# Altium schematic sheet Telemetry.SchDoc
size A3; SheetNumber: 6; SheetTotal: 7
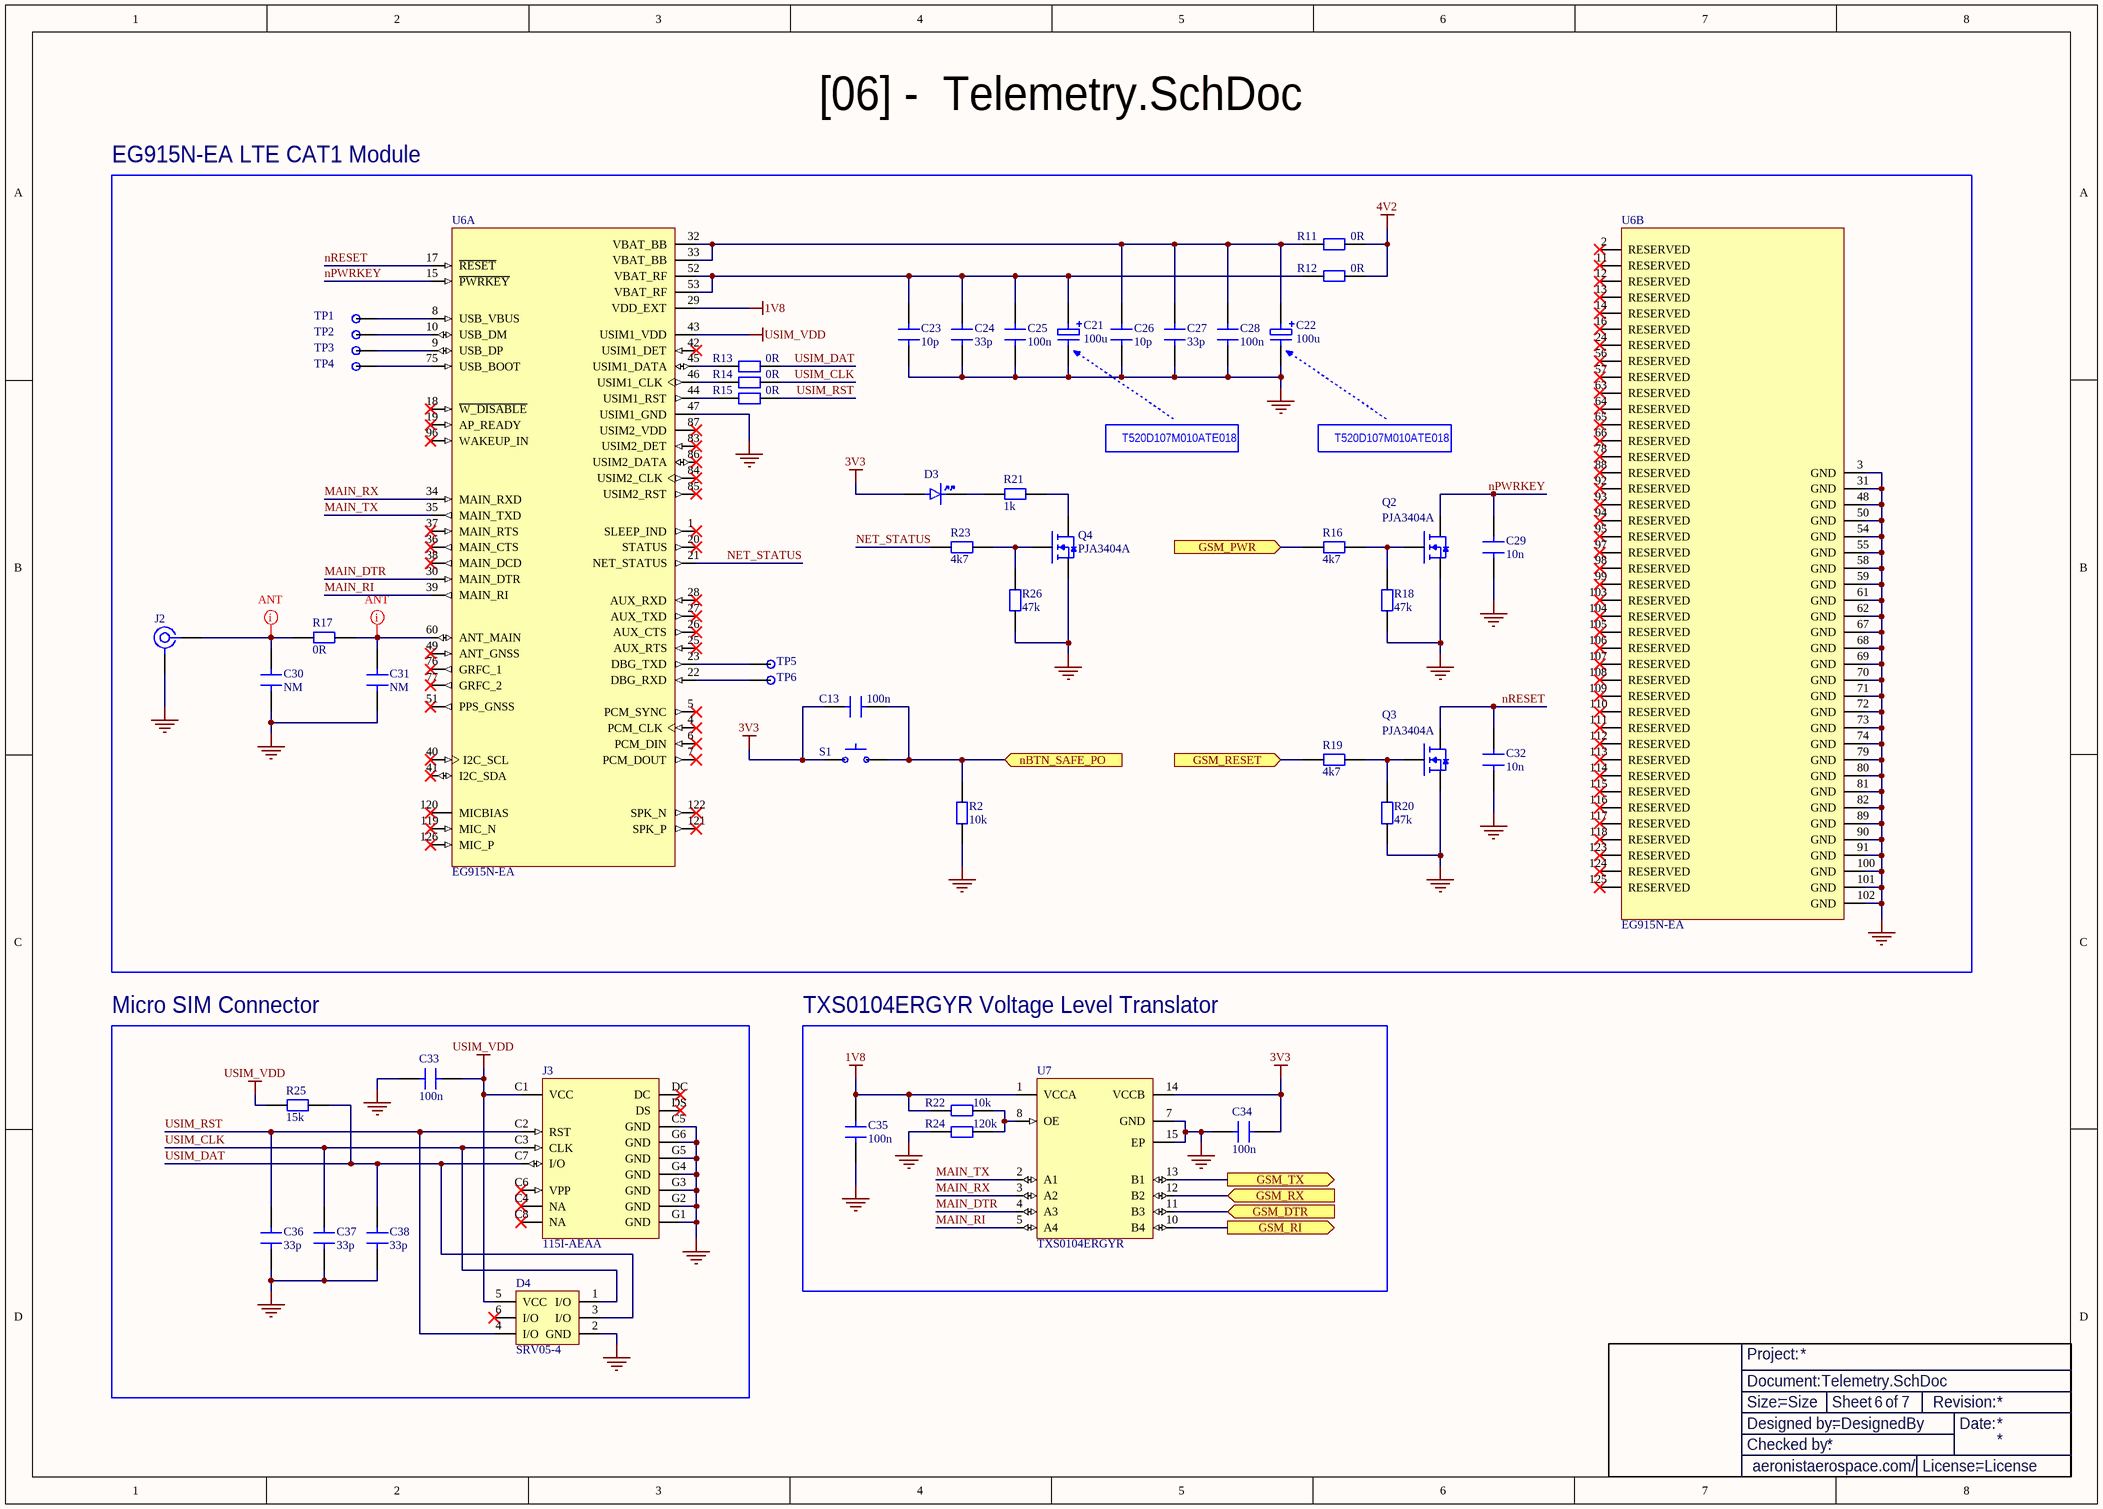
[diagram p0: Telemetry.SchDoc]

## Parts
?  Title Block  (value not drawn)  (graphical)
C13  100n  [CAP 0402]
C21  100u  [CAP TANT D Case]
C22  100u  [CAP TANT D Case]
C23  10p  [CAP 0402]
C24  33p  [CAP 0402]
C25  100n  [CAP 0402]
C26  10p  [CAP 0402]
C27  33p  [CAP 0402]
C28  100n  [CAP 0402]
C29  10n  [CAP 0402]
C30  NM  [CAP 0402]
C31  NM  [CAP 0402]
C32  10n  [CAP 0402]
C33  100n  [CAP 0402]
C34  100n  [CAP 0402]
C35  100n  [CAP 0402]
C36  33p  [CAP 0402]
C37  33p  [CAP 0402]
C38  33p  [CAP 0402]
D3  LED 0805  [LED 0805]  (value not drawn)
D4  SRV05-4  [SOT-23-6]
J2  L-KLS1-SMA-KWE-7X7-15.1  [CONN SMA THT R/A]  (value not drawn)
J3  115I-AEAA  [115I-AEAA]
Q2  PJA3404A  [SOT23-3]
Q3  PJA3404A  [SOT23-3]
Q4  PJA3404A  [SOT23-3]
R2  10k  [RES 0402]
R11  0R  [RES 0805]
R12  0R  [RES 0805]
R13  0R  [RES 0402]
R14  0R  [RES 0402]
R15  0R  [RES 0402]
R16  4k7  [RES 0402]
R17  0R  [RES 0402]
R18  47k  [RES 0402]
R19  4k7  [RES 0402]
R20  47k  [RES 0402]
R21  1k  [RES 0402]
R22  10k  [RES 0402]
R23  4k7  [RES 0402]
R24  120k  [RES 0402]
R25  15k  [RES 0402]
R26  47k  [RES 0402]
S1  SW Tact 4.6x3.2mm  [SW TACT 4.6X3.2MM]  (value not drawn)
TP1  Test Point  [Test Point]  (value not drawn)
TP2  Test Point  [Test Point]  (value not drawn)
TP3  Test Point  [Test Point]  (value not drawn)
TP4  Test Point  [Test Point]  (value not drawn)
TP5  Test Point  [Test Point]  (value not drawn)
TP6  Test Point  [Test Point]  (value not drawn)
U6  EG915N-EA  [EG915N]  (parts A,B of 2)
U7  TXS0104ERGYR  [VQFN-14]

## Blocks framed on the sheet
EG915N-EA LTE CAT1 Module: C13 C21-C32 D3 J2 Q2-Q4 R2 R11-R21 R23 R26 S1 TP1-TP6 U6
Micro SIM Connector: C33 C36-C38 D4 J3 R25
TXS0104ERGYR Voltage Level Translator: C34 C35 R22 R24 U7

## Ports
GSM_DTR (in, see MCU[6C]), GSM_PWR (in, see MCU[6C]), GSM_RESET (in, see MCU[6C]), GSM_RI (out, see MCU[6C]), GSM_RX (in, see MCU[6C]), GSM_TX (out, see MCU[6C]), nBTN_SAFE_PO (in, see MCU[4C])

## Nets
1V8: C35.1 R22.2 U6.29(VDD_EXT) U7.1(VCCA)
3V3: C13.2 C34.1 D3.A S1.4 U7.14(VCCB)
4V2: R11.2 R12.2
GND: C21.2 C22.2 C23.1 C24.1 C25.1 C26.1 C27.1 C28.1 C29.1 C30.2 C31.2 C32.1 C33.2 C34.2 C35.2 C36.2 C37.2 C38.2 D4.2(GND) J2.2 J3.C5(GND) J3.G1(GND) J3.G2(GND) J3.G3(GND) J3.G4(GND) J3.G5(GND) J3.G6(GND) Q2.2(S) Q3.2(S) Q4.2(S) R2.2 R18.2 R20.2 R24.1 R26.2 U6.3(GND) U6.31(GND) U6.47(USIM1_GND) U6.48(GND) U6.50(GND) U6.54(GND) U6.55(GND) U6.58(GND) U6.59(GND) U6.61(GND) U6.62(GND) U6.67(GND) U6.68(GND) U6.69(GND) U6.70(GND) U6.71(GND) U6.72(GND) U6.73(GND) U6.74(GND) U6.79(GND) U6.80(GND) U6.81(GND) U6.82(GND) U6.89(GND) U6.90(GND) U6.91(GND) U6.100(GND) U6.101(GND) U6.102(GND) U7.7(GND) U7.15(EP)
USIM_VDD: C33.1 D4.5(VCC) J3.C1(VCC) R25.1 U6.43(USIM1_VDD)
GSM_DTR: U7.11(B3) ; port GSM_DTR
GSM_PWR: R16.2 ; port GSM_PWR
GSM_RESET: R19.2 ; port GSM_RESET
GSM_RI: U7.10(B4) ; port GSM_RI
GSM_RX: U7.12(B2) ; port GSM_RX
GSM_TX: U7.13(B1) ; port GSM_TX
MAIN_DTR: U6.30(MAIN_DTR) U7.4(A3)
MAIN_RI: U6.39(MAIN_RI) U7.5(A4)
MAIN_RX: U6.34(MAIN_RXD) U7.3(A2)
MAIN_TX: U6.35(MAIN_TXD) U7.2(A1)
nBTN_SAFE_PO: C13.1 R2.1 S1.2 ; port nBTN_SAFE_PO
NET_STATUS: R23.2 U6.21(NET_STATUS)
nPWRKEY: C29.2 Q2.3(D) U6.15(~{PWRKEY})
nRESET: C32.2 Q3.3(D) U6.17(~{RESET})
USIM_CLK: C37.1 D4.1(I/O) J3.C3(CLK) R14.1
USIM_DAT: C38.1 D4.3(I/O) J3.C7(I/O) R13.1 R25.2
USIM_RST: C36.1 D4.4(I/O) J3.C2(RST) R15.1
NetC21_1: C21.1 C23.2 C24.2 C25.2 R12.1 U6.52(VBAT_RF) U6.53(VBAT_RF)
NetC22_1: C22.1 C26.2 C27.2 C28.2 R11.1 U6.32(VBAT_BB) U6.33(VBAT_BB)
NetC30_1: C30.1 J2.1 R17.1
NetC31_1: C31.1 R17.2 U6.60(ANT_MAIN)
NetD3_K: D3.K R21.1
NetQ2_1: Q2.1(G) R16.1 R18.1
NetQ3_1: Q3.1(G) R19.1 R20.1
NetQ4_1: Q4.1(G) R23.1 R26.1
NetQ4_3: Q4.3(D) R21.2
NetR13_2: R13.2 U6.45(USIM1_DATA)
NetR14_2: R14.2 U6.46(USIM1_CLK)
NetR15_2: R15.2 U6.44(USIM1_RST)
NetR22_1: R22.1 R24.2 U7.8(OE)
NetTP1_TP: TP1.TP U6.8(USB_VBUS)
NetTP2_TP: TP2.TP U6.10(USB_DM)
NetTP3_TP: TP3.TP U6.9(USB_DP)
NetTP4_TP: TP4.TP U6.75(USB_BOOT)
NetTP5_TP: TP5.TP U6.23(DBG_TXD)
NetTP6_TP: TP6.TP U6.22(DBG_RXD)

Not connected (* = marked no-connect by the designer): D4 6(I/O)*; J3 C4(NA)* C6(VPP)* C8(NA)* DC* DS*; U6 1(SLEEP_IND)* 2(RESERVED)* 4(PCM_CLK)* 5(PCM_SYNC)* 6(PCM_DIN)* 7(PCM_DOUT)* 11(RESERVED)* 12(RESERVED)* 13(RESERVED)* 14(RESERVED)* 16(RESERVED)* 18(~{W_DISABLE})* 19(AP_READY)* 20(STATUS)* 24(RESERVED)* 25(AUX_RTS)* 26(AUX_CTS)* 27(AUX_TXD)* 28(AUX_RXD)* 36(MAIN_CTS)* 37(MAIN_RTS)* 38(MAIN_DCD)* 40(I2C_SCL)* 41(I2C_SDA)* 42(USIM1_DET)* 49(ANT_GNSS)* 51(PPS_GNSS)* 56(RESERVED)* 57(RESERVED)* 63(RESERVED)* 64(RESERVED)* 65(RESERVED)* 66(RESERVED)* 76(GRFC_1)* 77(GRFC_2)* 78(RESERVED)* 83(USIM2_DET)* 84(USIM2_CLK)* 85(USIM2_RST)* 86(USIM2_DATA)* 87(USIM2_VDD)* 88(RESERVED)* 92(RESERVED)* 93(RESERVED)* 94(RESERVED)* 95(RESERVED)* 96(WAKEUP_IN)* 97(RESERVED)* 98(RESERVED)* 99(RESERVED)* 103(RESERVED)* 104(RESERVED)* 105(RESERVED)* 106(RESERVED)* 107(RESERVED)* 108(RESERVED)* 109(RESERVED)* 110(RESERVED)* 111(RESERVED)* 112(RESERVED)* 113(RESERVED)* 114(RESERVED)* 115(RESERVED)* 116(RESERVED)* 117(RESERVED)* 118(RESERVED)* 119(MIC_N)* 120(MICBIAS)* 121(SPK_P)* 122(SPK_N)* 123(RESERVED)* 124(RESERVED)* 125(RESERVED)* 126(MIC_P)*

## Layout directives
net class ANT: NetC30_1, NetC31_1

## Notes on the sheet
- [06] -  Telemetry.SchDoc
- T520D107M010ATE018
- (in symbol Title Block) Project:; Document:; Size:; Sheet; of; Revision:; Designed by:; Date:; Checked by:; aeronistaerospace.com/; License:

## Library data of the parts
C13 C23-C38 = CAP 0402: Capacitor SMD 0402
C21 C22 = CAP TANT D Case: Capacitor Tantalum SMD D Case
D3 = LED 0805: LED 0805 SMD
D4 = SRV05-4: SRV Series 17.5 V 3 pF SMT RailClamp® Low Capacitance TVS Diode Array SOT-23-6; Manufacturer: Semtech; Manufacturer Part Number: SRV05-4.TCT; Breakdown Voltage: 6V; Value: 5pF; Clamping Voltage: 12.5V; Current: 5A; Direction: Unidirectional; ESD Protection: Yes; Leakage Current: 5µA; Max Power Dissipation: 300W; Number of Bidirectional Channels: 4; Number of Elements: 1; Operating Supply Voltage: 5V; Peak Pulse Current: 12A; Test Current: 1mA; Supplier: Arrow Electronics; Supplier Part Number: SRV05-4.TCT; RoHS: Compliant; Category: TVS Diodes; Stock: 1665000; Pricing: 3000=0,3492 (USD); Case/Package: SOT-23; China RoHS: Compliant; Depth: 1.6mm; Height: 1.15mm; Lead Free: Lead Free; Length: 2.9mm; Lifecycle Status: Production; Max Breakdown Voltage: 6V; Max Operating Temperature: 125°C; Max Reverse Leakage Current: 5µA; Min Breakdown Voltage: 6V; Min Operating Temperature: -55°C; Mounting Technology: Surface Mount; Number of Channels: 4; Pins: 6; Number of Terminals: 6; Packaging: Cut Tape; Peak Pulse Power: 300W; Polarity: Unidirectional; Power Line Protection: Yes; Power Rating: 300W; Radiation Hardening: No; REACH SVHC: Yes; Reverse Breakdown Voltage: 6V; Reverse Standoff Voltage: 5V; Schedule B: 8542390000, 8542390000|8542390000|8542390000|8542390000|8542390000; Voltage: 5V; Voltage Rating (DC): 5V; Width: 1.6mm; Working Voltage: 5V; ComponentLink1URL: https://datasheet.octopart.com:443/SRV05-4.TCT-Semtech-datasheet-33008608.pdf?src-supplier=IHS; ComponentLink1Description: https://datasheet.octopart.com:443/SRV05-4.TCT-Semtech-datasheet-33008608.pdf?src-supplier=IHS; ComponentLink2URL: https://datasheet.octopart.com:443/SRV05-4.TCT-Semtech-datasheet-604703.pdf?src-supplier=Arrow+Electronics; ComponentLink2Description: https://datasheet.octopart.com:443/SRV05-4.TCT-Semtech-datasheet-604703.pdf?src-supplier=Arrow+Electronics; ComponentLink3URL: https://datasheet.octopart.com:443/SRV05-4.TCT-Semtech-datasheet-41194810.pdf?src-supplier=TME; ComponentLink3Description: https://datasheet.octopart.com:443/SRV05-4.TCT-Semtech-datasheet-41194810.pdf?src-supplier=TME; ComponentLink4URL: https://datasheet.octopart.com:443/SRV05-4.TCT-Semtech-datasheet-10542293.pdf?src-supplier=Farnell; ComponentLink4Description: https://datasheet.octopart.com:443/SRV05-4.TCT-Semtech-datasheet-10542293.pdf?src-supplier=Farnell; ComponentLink5URL: https://datasheet.octopart.com:443/SRV05-4.TCT-Semtech-datasheet-14048601.pdf?src-supplier=iiiC; ComponentLink5Description: https://datasheet.octopart.com:443/SRV05-4.TCT-Semtech-datasheet-14048601.pdf?src-supplier=iiiC
J2 = CONN SMA THT R/A: RF SMA Connector, 1 Contact(s), Board Mount, R/A
J3 = 115I-AEAA: 115I-AEAA Connector Micro SIM Card Push-Pull 6P SMD Card Edge Connectors
Q2-Q4 = MOSFET N-CH: SOT-23-3 package, N-Channel MOSFET
R2 R13-R26 = RES 0402: Resistor SMD 0402
R11 R12 = RES 0805: Resistor SMD 0805
S1 = SW Tact 4.6x3.2mm: 4.6×3.2 mm tactile push-button switch, SPST, momentary, SMD.
TP1-TP6 = Test Point: Test Point, PCB Pad Only, Ø1.2mm
U6 = EG915N-EA: Cellular, Navigation BeiDou, EDGE, Galileo, GLONASS, GNSS, GPRS, GPS, GSM, HSPA+, LTE, UMTS, WCDMA Transceiver Module 915MHz Antenna Not Included Surface Mount; MF: Quectel; MP: EG915NEAAC-N05-SNNSA; SnapEDA_Link: https://www.snapeda.com/parts/EG915NEAAC-N05-SNNSA/Quectel/view-part/?ref=snap; Package: None; Value: *; Check_prices: https://www.snapeda.com/parts/EG915NEAAC-N05-SNNSA/Quectel/view-part/?ref=eda
U7 = TXS0104ERGYR: Four-bit bidirectional voltage-level shifter for open-drain and push-pull applications 14-VQFN -40 to 85; Manufacturer: Texas Instruments; Manufacturer Lifecycle Status: ACTIVE; Data Rate: 24mbps; High Level Output Current: -20µA; Logic Function: Translator; Low Level Output Current: 1mA; Max Junction Temperature (Tj): 150°C; Max Supply Voltage: 5.5V; Min Supply Voltage: 1.65V; Number of Bits: 4; Number of Outputs: 1; Propagation Delay: 260ns; Quiescent Current: 14.4µA; Supplier: Mouser; Supplier Part Number: 595-TXS0104ERGYR; Manufacturer Part Number: TXS0104ERGYR; RoHS: Compliant; Category: Voltage Level Shifters; Stock: 2192; Pricing: 1=1,75, 10=1,12, 50=1, 100=0,824, 1000=0,572, 10000=0,477 (USD); Ambient Temperature Range High: 85°C; Case/Package: VQFN; Height: 1mm; Lead Free: Lead Free; Length: 3.5mm; Lifecycle Status: Production; Max Operating Temperature: 85°C; Min Operating Temperature: -40°C; Mounting Technology: Surface Mount; Number of Channels: 4; Number of Circuits: 4; Number of Inputs: 4; Pins: 14; Output Type: Voltage; Radiation Hardening: No; REACH SVHC: No; Schedule B: 8542390000, 8542390000|8542390000|8542390000|8542390000|8542390000; Termination: SMD/SMT; Thickness: 900µm; Topology: Push-Pull; Turn-On Delay Time: 260ns; Weight: 32.205058mg; Width: 3.5mm; ComponentLink1URL: https://sigma.octopart.com:443/183889324/technical_drawing/Texas-Instruments-TXS0104ERGYR.pdf?src-supplier=Texas+Instruments; ComponentLink1Description: https://sigma.octopart.com:443/183889324/technical_drawing/Texas-Instruments-TXS0104ERGYR.pdf?src-supplier=Texas+Instruments; ComponentLink2URL: https://octopart.com:443/opatz8j6/c1?t=xVBGTrUMwakIB2VMHsXsxFUFoPPT116Fsct1EWR9IwfXtqfzdT-xgAxW5td2RsbUlxN5IpaEpB4BuRdG8tMDFxpQIH58bRCAg85QcnzMA2iX5Assfic2EhPQupKuLb_cOTMFWPcXTxS2FUOoAhYOK1w-GfJlQcIkMH9-B3PKcGFJzuVIUGJVi6wZN00izmAKVlwLJHwpRzhvGfN5ZsevnHBOdT1f977CqvXWcq1EqP2cdaj__zsiItfH1PHfS6TsDAssu1BPNBol1VPjq_1IDPaqyAgjdLA9OBhVf2YXS4dAW6zVEFWevrINt7e5qdo0VTMiHp_a4jdlpT7TaxEF9CWdjquLYdVJ0c4eakITkpijkklV4FFSG-75YO-DnXU4D48feA&src-supplier=Texas+Instruments; ComponentLink2Description: https://octopart.com:443/opatz8j6/c1?t=xVBGTrUMwakIB2VMHsXsxFUFoPPT116Fsct1EWR9IwfXtqfzdT-xgAxW5td2RsbUlxN5IpaEpB4BuRdG8tMDFxpQIH58bRCAg85QcnzMA2iX5Assfic2EhPQupKuLb_cOTMFWPcXTxS2FUOoAhYOK1w-GfJlQcIkMH9-B3PKcGFJzuVIUGJVi6wZN00izmAKVlwLJHwpRzhvGfN5ZsevnHBOdT1f977CqvXWcq1EqP2cdaj__zsiItfH1PHfS6TsDAssu1BPNBol1VPjq_1IDPaqyAgjdLA9OBhVf2YXS4dAW6zVEFWevrINt7e5qdo0VTMiHp_a4jdlpT7TaxEF9CWdjquLYdVJ0c4eakITkpijkklV4FFSG-75YO-DnXU4D48feA&src-supplier=Texas+Instruments; ComponentLink3URL: https://datasheet.octopart.com:443/TXS0104ERGYR-Texas-Instruments-datasheet-17423550.pdf?src-supplier=Texas+Instruments; ComponentLink3Description: https://datasheet.octopart.com:443/TXS0104ERGYR-Texas-Instruments-datasheet-17423550.pdf?src-supplier=Texas+Instruments; ComponentLink4URL: https://datasheet.octopart.com:443/TXS0104ERGYR-Texas-Instruments-datasheet-10254998.pdf?src-supplier=Texas+Instruments; ComponentLink4Description: https://datasheet.octopart.com:443/TXS0104ERGYR-Texas-Instruments-datasheet-10254998.pdf?src-supplier=Texas+Instruments; ComponentLink5URL: https://sigma.octopart.com:443/49249952/technical_drawing/Texas-Instruments-TXS0104ERGYR.pdf?src-supplier=Texas+Instruments; ComponentLink5Description: https://sigma.octopart.com:443/49249952/technical_drawing/Texas-Instruments-TXS0104ERGYR.pdf?src-supplier=Texas+Instruments; ComponentLink6URL: https://datasheet.octopart.com:443/TXS0104ERGYR-Texas-Instruments-datasheet-151984.pdf?src-supplier=Texas+Instruments; ComponentLink6Description: https://datasheet.octopart.com:443/TXS0104ERGYR-Texas-Instruments-datasheet-151984.pdf?src-supplier=Texas+Instruments; ComponentLink7URL: https://datasheet.octopart.com:443/TXS0104ERGYR-Texas-Instruments-datasheet-34148596.pdf?src-supplier=Farnell; ComponentLink7Description: https://datasheet.octopart.com:443/TXS0104ERGYR-Texas-Instruments-datasheet-34148596.pdf?src-supplier=Farnell; ComponentLink8URL: https://datasheet.octopart.com:443/TXS0104ERGYR-Texas-Instruments-datasheet-66618006.pdf?src-supplier=Farnell; ComponentLink8Description: https://datasheet.octopart.com:443/TXS0104ERGYR-Texas-Instruments-datasheet-66618006.pdf?src-supplier=Farnell; ComponentLink9URL: https://datasheet.octopart.com:443/TXS0104ERGYR-Texas-Instruments-datasheet-48033022.pdf?src-supplier=Farnell; ComponentLink9Description: https://datasheet.octopart.com:443/TXS0104ERGYR-Texas-Instruments-datasheet-48033022.pdf?src-supplier=Farnell; ComponentLink10URL: https://datasheet.octopart.com:443/TXS0104ERGYR-Texas-Instruments-datasheet-17023331.pdf?src-supplier=Farnell; ComponentLink10Description: https://datasheet.octopart.com:443/TXS0104ERGYR-Texas-Instruments-datasheet-17023331.pdf?src-supplier=Farnell; ComponentLink11URL: https://datasheet.octopart.com:443/TXS0104ERGYR-Texas-Instruments-datasheet-21828336.pdf?src-supplier=Farnell; ComponentLink11Description: https://datasheet.octopart.com:443/TXS0104ERGYR-Texas-Instruments-datasheet-21828336.pdf?src-supplier=Farnell; ComponentLink12URL: https://datasheet.octopart.com:443/TXS0104ERGYR-Texas-Instruments-datasheet-164421215.pdf?src-supplier=SHENGYU+ELECTRONICS; ComponentLink12Description: https://datasheet.octopart.com:443/TXS0104ERGYR-Texas-Instruments-datasheet-164421215.pdf?src-supplier=SHENGYU+ELECTRONICS; ComponentLink13URL: https://datasheet.octopart.com:443/TXS0104ERGYR-Texas-Instruments-datasheet-165804952.pdf?src-supplier=LCSC; ComponentLink13Description: https://datasheet.octopart.com:443/TXS0104ERGYR-Texas-Instruments-datasheet-165804952.pdf?src-supplier=LCSC; ComponentLink14URL: https://datasheet.octopart.com:443/TXS0104ERGYR-Texas-Instruments-datasheet-159118389.pdf?src-supplier=LCSC; ComponentLink14Description: https://datasheet.octopart.com:443/TXS0104ERGYR-Texas-Instruments-datasheet-159118389.pdf?src-supplier=LCSC; ComponentLink15URL: https://datasheet.octopart.com:443/TXS0104ERGYR-Texas-Instruments-datasheet-137316104.pdf?src-supplier=Future+Electronics; ComponentLink15Description: https://datasheet.octopart.com:443/TXS0104ERGYR-Texas-Instruments-datasheet-137316104.pdf?src-supplier=Future+Electronics; ComponentLink16URL: https://datasheet.octopart.com:443/TXS0104ERGYR-Texas-Instruments-datasheet-10979038.pdf?src-supplier=Arrow+Electronics; ComponentLink16Description: https://datasheet.octopart.com:443/TXS0104ERGYR-Texas-Instruments-datasheet-10979038.pdf?src-supplier=Arrow+Electronics; ComponentLink17URL: https://datasheet.octopart.com:443/TXS0104ERGYR-Texas-Instruments-datasheet-18313.pdf?src-supplier=DigiKey; ComponentLink17Description: https://datasheet.octopart.com:443/TXS0104ERGYR-Texas-Instruments-datasheet-18313.pdf?src-supplier=DigiKey; ComponentLink18URL: http://sigma.octopart.com:80/reach_statement/Texas-Instruments-company-64.pdf?src-supplier=Compliance+Statements; ComponentLink18Description: http://sigma.octopart.com:80/reach_statement/Texas-Instruments-company-64.pdf?src-supplier=Compliance+Statements; ComponentLink19URL: http://sigma.octopart.com:80/conflict_mineral_statement/Texas-Instruments-company-63.pdf?src-supplier=Compliance+Statements; ComponentLink19Description: http://sigma.octopart.com:80/conflict_mineral_statement/Texas-Instruments-company-63.pdf?src-supplier=Compliance+Statements